# Altium schematic sheet Connectors.SchDoc
size A; SheetNumber: 2; SheetTotal: 2
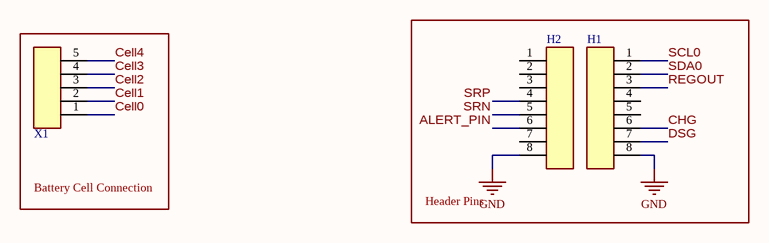
[diagram p0: Connectors.SchDoc]

## Parts
H1  1x8 Header  [[Header] 1x8 Male]  (value not drawn)
H2  1x8 Header  [[Header] 1x8 Male]  (value not drawn)
X1  [JST] 5pin Female  [[JST] 5pin Female]  (value not drawn)

## Blocks framed on the sheet
Battery Cell Connection: X1
Header Pins: H1 H2

## Nets
GND: H1.8 H2.8
ALERT_PIN: H2.6
Cell0: X1.1
Cell1: X1.2
Cell2: X1.3
Cell3: X1.4
Cell4: X1.5
CHG: H1.6
DSG: H1.7
REGOUT: H1.3
SCL0: H1.1
SDA0: H1.2
SRN: H2.5
SRP: H2.4

Not connected (* = marked no-connect by the designer): H1 4 5; H2 1 2 3 7

## Library data of the parts
H1 H2 = [Header] 1x8 Male: 2.54mm pitch